# Altium schematic sheet Temperature_Sense_Section.SchDoc
size A4; DocumentNumber: 15; SheetNumber: 15; SheetTotal: 17
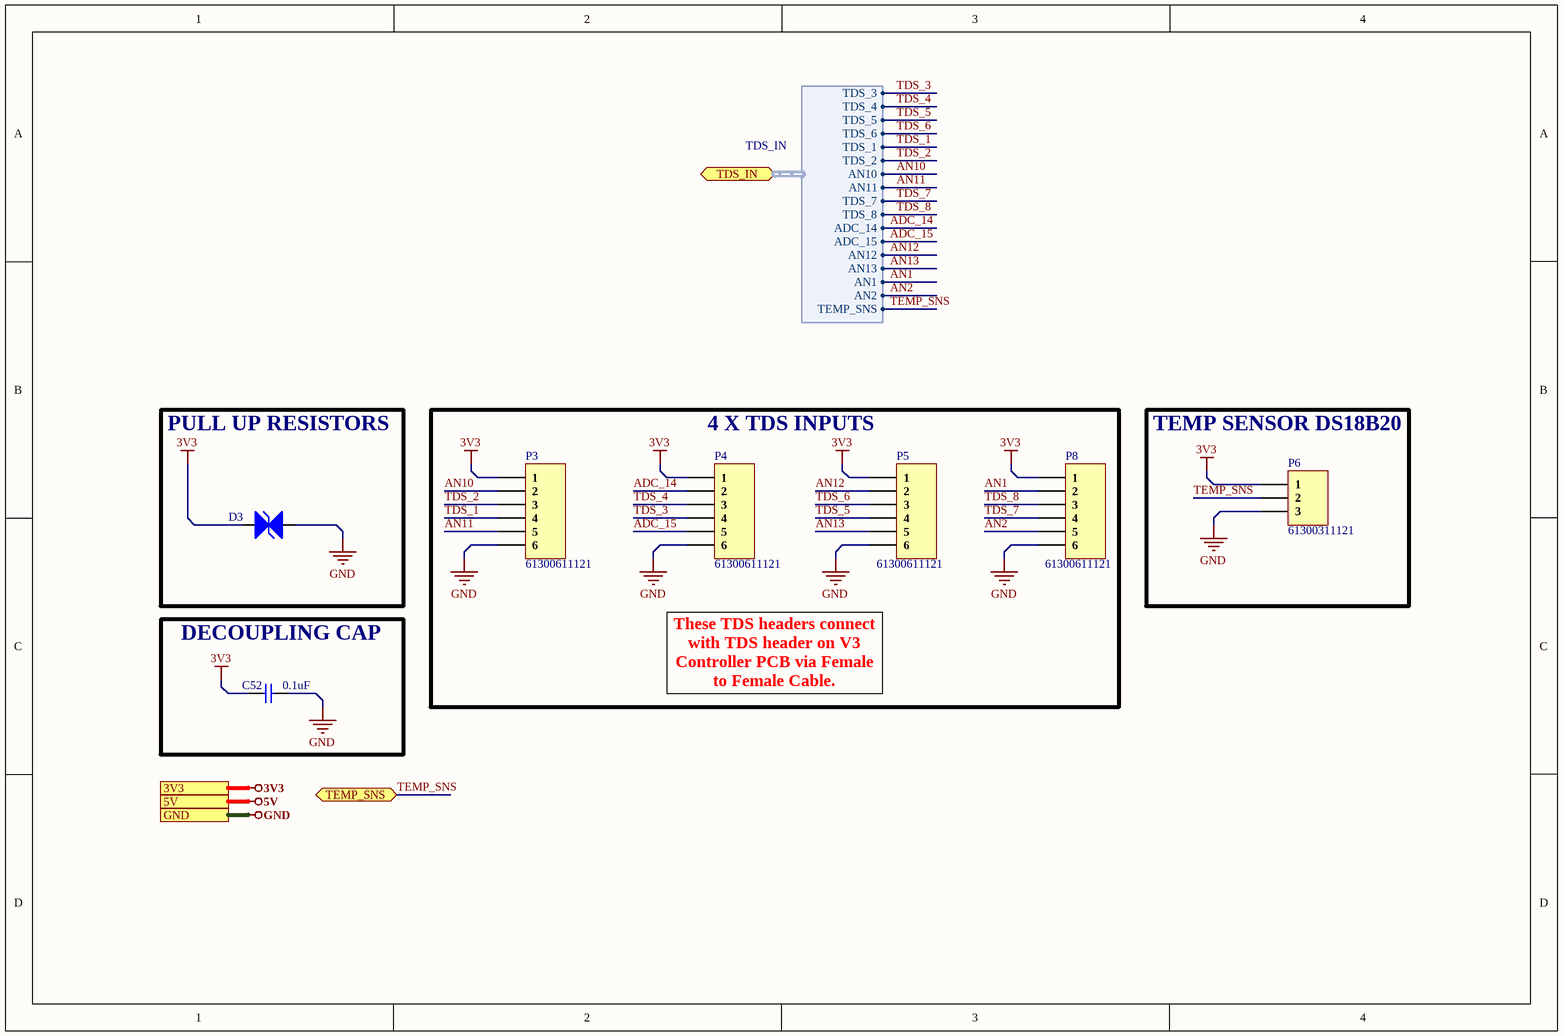
[diagram p0: Temperature_Sense_Section.SchDoc]

## Parts
C52  0.1uF  [Cap0603]
D3  SMAJ5.0CA  [SMAJ5.0CA]  (value not drawn)
P3  61300611121  [HDR1X6]
P4  61300611121  [HDR1X6]
P5  61300611121  [HDR1X6]
P6  61300311121  [HDR1X3]
P8  61300611121  [HDR1X6]

## Blocks framed on the sheet
PULL UP RESISTORS: D3
4 X TDS INPUTS: P3-P5 P8
TEMP SENSOR DS18B20: P6
DECOUPLING CAP: C52

## Ports
3V3, 5V, GND, TDS_IN (bidir, harness TDS_IN), TEMP_SNS (bidir)

## Harnesses
TDS_IN: TDS_1, TDS_2, AN10, AN11, TDS_3, TDS_4, TDS_5, TDS_6, TDS_7, TDS_8, ADC_14, ADC_15, AN12, AN13, AN1, AN2, TEMP_SNS

## Nets
3V3: C52.1 D3.2(A) P3.1 P4.1 P5.1 P6.1 P8.1 ; port 3V3
5V: port 5V
GND: C52.2 D3.1(K) P3.6 P4.6 P5.6 P6.3 P8.6 ; port GND
ADC_14: P4.2 ; port TDS_IN.ADC_14
ADC_15: P4.5 ; port TDS_IN.ADC_15
AN1: P8.2 ; port TDS_IN.AN1
AN2: P8.5 ; port TDS_IN.AN2
AN10: P3.2 ; port TDS_IN.AN10
AN11: P3.5 ; port TDS_IN.AN11
AN12: P5.2 ; port TDS_IN.AN12
AN13: P5.5 ; port TDS_IN.AN13
TDS_1: P3.4 ; port TDS_IN.TDS_1
TDS_2: P3.3 ; port TDS_IN.TDS_2
TDS_3: P4.4 ; port TDS_IN.TDS_3
TDS_4: P4.3 ; port TDS_IN.TDS_4
TDS_5: P5.4 ; port TDS_IN.TDS_5
TDS_6: P5.3 ; port TDS_IN.TDS_6
TDS_7: P8.4 ; port TDS_IN.TDS_7
TDS_8: P8.3 ; port TDS_IN.TDS_8
TEMP_SNS: P6.2 ; port TEMP_SNS, port TDS_IN.TEMP_SNS

## Notes on the sheet
- These TDS headers connect with TDS header on V3 Controller PCB via Female to Female Cable.

## Library data of the parts
C52 = CC0603ZRY5V9BB104: CAP CER 0.1UF 50V Y5V 0603; Manufacturer: Yageo; Capacitance: 100nF; Tolerance: 80%; Supplier 1: Digi-Key; Manufacturer Part Number: CC0603ZRY5V9BB104; Stock 1: 15000880; Pricing 1: 1=0.1, 10=0.075, 100=0.0334, 500=0.02386, 1000=0.01874 (USD); Mount: Surface Mount; Case/Package: 0603; Number of Pins: 2; Case Code (Metric): 1608; Case Code (Imperial): 0603; Min Operating Temperature: -30°C; Max Operating Temperature: 85°C; Dielectric: Y5V; Voltage Rating: 50V; Package Quantity: 1; Packaging: Tape and Reel; Voltage Rating (DC): 50V; Termination: SMD/SMT; Composition: Ceramic; Voltage: 50V; Length: 1.6mm; Height: 0.8mm; Width: 0.031inch; Thickness: 0.035inch; Depth: 0.8mm; Radiation Hardening: No; REACH SVHC: No SVHC; Lead Free: Lead Free; Halogen Free: Halogen Free; ComponentLink1URL: http://www.yageo.com/documents/recent/UPY-GPHC_Y5V_6.3V-to-50V_8.pdf?src-supplier=Digi-Key; ComponentLink1Description: http://www.yageo.com/documents/recent/UPY-GPHC_Y5V_6.3V-to-50V_8.pdf?src-supplier=Digi-Key; ComponentLink2URL: http://www.yageo.com/documents/recent/UPY-GPHC_Y5V_6.3V-to-50V_5.pdf?src-supplier=Avnet+Europe; ComponentLink2Description: http://www.yageo.com/documents/recent/UPY-GPHC_Y5V_6.3V-to-50V_5.pdf?src-supplier=Avnet+Europe; ComponentLink3URL: https://www.verical.com/server-webapp/html/getDatasheet?partID=403611&src-supplier=Verical; ComponentLink3Description: https://www.verical.com/server-webapp/html/getDatasheet?partID=403611&src-supplier=Verical; ComponentLink4URL: http://www.mouser.com/ds/2/447/Yageo_UPY-GP_NP0_16V-to-50V_9-358835.pdf?src-supplier=Mouser; ComponentLink4Description: http://www.mouser.com/ds/2/447/Yageo_UPY-GP_NP0_16V-to-50V_9-358835.pdf?src-supplier=Mouser; ComponentLink5URL: http://www.farnell.com/datasheets/1132289.pdf?src-supplier=Element14; ComponentLink5Description: http://www.farnell.com/datasheets/1132289.pdf?src-supplier=Element14; Supplier Part Number 1: 311-1343-1-ND
D3 = SMAJ5.0CA: 800uA 43.5A 9.2V 6.4V 5V 7V Bi-Directional SMA TVS ROHS; Manufacturer: Shandong Jingdao Microelectronics; ComponentLink1Description: LCSC; ComponentLink1URL: https://lcsc.com/product-detail/TVS_Shandong-Jingdao-Microelectronics-SMAJ5-0CA_C353441.html; Manufacturer Part Number: SMAJ5.0CA; Footprint: SMA
P3-P5 P8 = Header 1x6: CONN HEADER VERT 6POS 2.54MM; Manufacturer: Wurth Electronics; Current Rating: 3A; Voltage Rating: 250V; Number of Positions: 6; Gender: Male; Connector Type: Male Pin; Pitch: 0.1inch; Supplier 1: Digi-Key; Manufacturer Part Number: 61300611121; Stock 1: 14573; Pricing 1: 1=0.33, 10=0.279, 25=0.232, 50=0.194, 100=0.176, 1000=0.16 (USD); Mount: Through Hole; Contact Plating: Gold; Contact Material: Copper Alloy,Copper; Housing Material: PBT; Color: Black; Min Operating Temperature: -40°C; Max Operating Temperature: 125°C; Number of Rows: 1; Contact Gender: Male; Packaging: Bulk; Termination: Through Hole; Number of Contacts: 6; Contact Mating Length: 0.236inch; REACH SVHC: Unknown; Lead Free: Lead Free; ComponentLink1URL: http://www.farnell.com/cad/1737268.pdf?src-supplier=Element14; ComponentLink1Description: http://www.farnell.com/cad/1737268.pdf?src-supplier=Element14; ComponentLink2URL: https://katalog.we-online.de/em/datasheet/6130xx11121.pdf?src-supplier=Digi-Key; ComponentLink2Description: https://katalog.we-online.de/em/datasheet/6130xx11121.pdf?src-supplier=Digi-Key; ComponentLink3URL: http://www.mouser.com/ds/2/445/6130xx11121-538006.pdf?src-supplier=Mouser; ComponentLink3Description: http://www.mouser.com/ds/2/445/6130xx11121-538006.pdf?src-supplier=Mouser; Supplier Part Number 1: 732-5319-ND
P6 = Header 1X3: CONN HEADER VERT 3POS 2.54MM; Manufacturer: Wurth Electronics; Number of Positions: 3; Gender: Male; Connector Type: Male Pin; Pitch: 0.1inch; Supplier 1: Digi-Key; Manufacturer Part Number: 61300311121; Stock 1: 81286; Pricing 1: 1=0.13, 10=0.106, 25=0.088, 50=0.074, 100=0.067, 1000=0.061 (USD); Mount: Through Hole; Contact Plating: Gold; Contact Material: Copper; Color: Black; Number of Rows: 1; Packaging: Bulk; Termination: Solder; Number of Contacts: 3; Contact Mating Length: 0.236inch; REACH SVHC: Unknown; Lead Free: Lead Free; ComponentLink1URL: http://www.farnell.com/cad/1737268.pdf?src-supplier=Element14; ComponentLink1Description: http://www.farnell.com/cad/1737268.pdf?src-supplier=Element14; ComponentLink2URL: https://katalog.we-online.de/em/datasheet/6130xx11121.pdf?src-supplier=Digi-Key; ComponentLink2Description: https://katalog.we-online.de/em/datasheet/6130xx11121.pdf?src-supplier=Digi-Key; Supplier Part Number 1: 732-5316-ND